# Altium project ESP32_Sound.PrjPcb
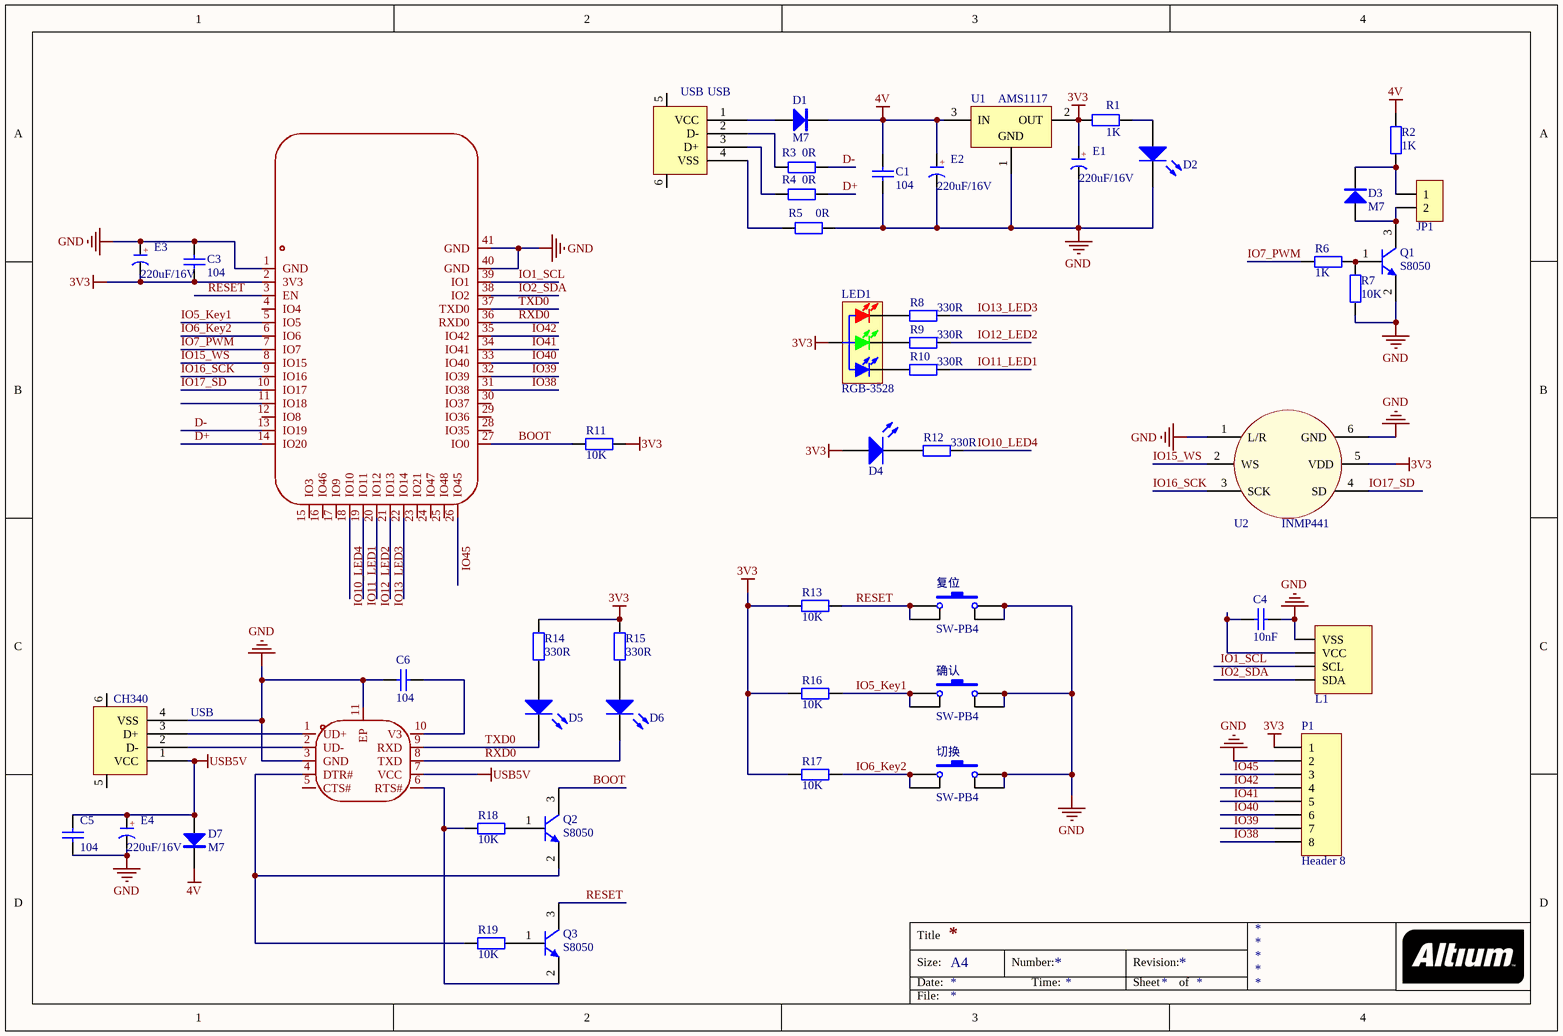
[diagram p0: ESP32_Sound.SchDoc]
1 sheet, 51 parts. Net scope: global (net labels, ports and power ports of the same name join across sheets).
Board file: ESP32_Sound.PcbDoc

## Sheet ESP32_Sound.SchDoc
size A4

### Parts
C1  104  [C 0805]
C3  104  [C 0805]
C4  10nF  [C 0805]
C5  104  [C 0805]
C6  104  [C 0805]
CH340  USB  [H-TypeC]
D1  M7  [DIODE-SMA]
D2  LED  [LED-0805]  (value not drawn)
D3  M7  [DIODE-SMA]
D4  LED  [LED-0805]  (value not drawn)
D5  LED  [LED-0805]  (value not drawn)
D6  LED  [LED-0805]  (value not drawn)
D7  M7  [DIODE-SMA]
E1  220uF/16V  [CAP 2.5*6.3*7]
E2  220uF/16V  [CAP 2.5*6.3*7]
E3  220uF/16V  [CAP 2.5*6.3*7]
E4  220uF/16V  [CAP 2.5*6.3*7]
JP1  HDR-1X2  [SIPA02]  (value not drawn)
L1  LCD12864 IIC  [LCD12864]  (value not drawn)
LED1  RGB-3528  [LED-RGB]
P1  Header 8  [HDR1X8]
Q1  S8050  [SOT89_L]
Q2  S8050  [SOT23-3L]
Q3  S8050  [SOT23-3L]
R1  1K  [R 0805]
R2  1K  [R 0805]
R3  0R  [CR3216-1206]
R4  0R  [CR3216-1206]
R5  0R  [CR3216-1206]
R6  1K  [R 0805]
R7  10K  [R 0805]
R8  330R  [R 0805]
R9  330R  [R 0805]
R10  330R  [R 0805]
R11  10K  [R 0805]
R12  330R  [R 0805]
R13  10K  [R 0805]
R14  330R  [R 0805]
R15  330R  [R 0805]
R16  10K  [R 0805]
R17  10K  [R 0805]
R18  10K  [R 0805]
R19  10K  [R 0805]
U1  AMS1117  [SOT-223]
U2  INMP441  [INMP441]
U3  ESP32-S3-WROOM-1(N16R8)  [WIRELM-SMD_ESP32-S3-WROOM-1]  (value not drawn)
U4  CH340K  [ESOP-10_L4.9-W3.9-P1.00-LS6.2-BL-EP]  (value not drawn)
USB  USB  [H-TypeC]
切换  SW-PB4  [TSW SMD-6*6*5]
复位  SW-PB4  [TSW SMD-6*6*5]
确认  SW-PB4  [TSW SMD-6*6*5]

### Nets
3V3: C3.1 D4.1(A) E1.1(A) E3.2(K) LED1.2(A) P1.1 R1.2 R11.2 R13.1 R14.2 R15.2 R16.1 R17.1 U1.2(OUT) U2.5(VDD) U3.2(3V3)
4V: C1.2 D1.2(K) D7.2(K) E2.1(A) R2.1 U1.3(IN)
GND: C1.1 C3.2 C4.1 C5.1 C6.2 CH340.4(VSS) D2.2(K) E1.2(K) E2.2(K) E3.1(A) E4.2(K) L1.1(VSS) P1.2 Q1.2(E) R5.1 R7.1 U1.1(GND) U2.1(L/R) U2.6(GND) U3.1(GND) U3.40(GND) U3.41(GND) U4.3(GND) U4.11(EP) 切换.2 切换.3 复位.2 复位.3 确认.2 确认.3
USB5V: C5.2 CH340.1(VCC) D7.1(A) E4.1(A) U4.7(VCC)
BOOT: Q2.3(C) R11.1 U3.27(IO0)
D+: R4.1 U3.14(IO20)
D-: R3.1 U3.13(IO19)
IO1_SCL: L1.3(SCL) U3.39(IO1)
IO2_SDA: L1.4(SDA) U3.38(IO2)
IO5_Key1: R16.2 U3.5(IO5) 确认.1 确认.4
IO6_Key2: R17.2 U3.6(IO6) 切换.1 切换.4
IO7_PWM: R6.1 U3.7(IO7)
IO10_LED4: R12.2 U3.18(IO10)
IO11_LED1: R10.2 U3.19(IO11)
IO12_LED2: R9.2 U3.20(IO12)
IO13_LED3: R8.2 U3.21(IO13)
IO15_WS: U2.2(WS) U3.8(IO15)
IO16_SCK: U2.3(SCK) U3.9(IO16)
IO17_SD: U2.4(SD) U3.10(IO17)
IO38: P1.8 U3.31(IO38)
IO39: P1.7 U3.32(IO39)
IO40: P1.6 U3.33(IO40)
IO41: P1.5 U3.34(IO41)
IO42: P1.4 U3.35(IO42)
IO45: P1.3 U3.26(IO45)
RESET: Q3.3(C) R13.2 U3.3(EN) 复位.1 复位.4
RXD0: D6.2(K) U3.36(RXD0) U4.8(TXD)
TXD0: D5.2(K) U3.37(TXD0) U4.9(RXD)
NetC4_2: C4.2 L1.2(VCC)
NetC6_1: C6.1 U4.10(V3)
NetCH340_2: CH340.2(D-) U4.2(UD-)
NetCH340_3: CH340.3(D+) U4.1(UD+)
NetD1_1: D1.1(A) USB.1(VCC)
NetD2_1: D2.1(A) R1.1
NetD3_1: D3.1(A) JP1.2 Q1.3(C)
NetD3_2: D3.2(K) JP1.1 R2.2
NetD4_2: D4.2(K) R12.1
NetD5_1: D5.1(A) R14.1
NetD6_1: D6.1(A) R15.1
NetLED1_1: LED1.1(RED_K) R8.1
NetLED1_3: LED1.3(GREEN_K) R9.1
NetLED1_4: LED1.4(BULE_K) R10.1
NetQ1_1: Q1.1(B) R6.2 R7.2
NetQ2_1: Q2.1(B) R18.2
NetQ2_2: Q2.2(E) R19.1 U4.4(DTR#)
NetQ3_1: Q3.1(B) R19.2
NetQ3_2: Q3.2(E) R18.1 U4.6(RTS#)
NetR3_2: R3.2 USB.2(D-)
NetR4_2: R4.2 USB.3(D+)
NetR5_2: R5.2 USB.4(VSS)

Not connected (* = marked no-connect by the designer): CH340 5 6; U3 4(IO4) 11(IO18) 12(IO8) 15(IO3) 16(IO46) 17(IO9) 22(IO14) 23(IO21) 24(IO47) 25(IO48) 28(IO35) 29(IO36) 30(IO37); U4 5(CTS#); USB 5 6

### Notes on the sheet
- Title
- Size:
- Date:
- A4
- Number:
- Time:
- Revision:
- Sheet
- of
- File:
- (in symbol C-CD) +

### Library data of the parts
C1 = Cap: 无极性电容
C3-C6 = Cap: Capacitor; Value: 1nF; Published: 8-Jun-2000; LatestRevisionDate: 17-Jul-2002; LatestRevisionNote: Re-released for DXP Platform.; PackageReference: RAD-0.3; Publisher: Altium Limited
CH340 USB = USB: USB接口
D1 D3 D7 = SS24: 肖特基二极管; 版权归属: 源创客; 属性: 40V/2A; BOM名称: 肖特基二极管; 学习资源: www.ooocke.com
D2 D4-D6 = LED: 发光二极管; Published: 8-Jun-2000; LatestRevisionDate: 08-Jul-2005; LatestRevisionNote: Mech Layer 1 removed.; PackageReference: LED-0; Publisher: Altium Limited
E1-E4 = C-CD: 贴片钽电容; 版权归属: 源创客; BOM名称: 贴片钽电容; 学习资源: www.ooocke.com
JP1 = Header 2: 2P接插件; 版权归属: 源创客; BOM名称: 2P接插件; 学习资源: www.ooocke.com
L1 = LCD12864 IIC: LCD SSD1306/SSD1315; BOM名称: 4P接插件; 版权归属: 源创客; 学习资源: www.ooocke.com
LED1 = LED-RGB-3528: 三基色LED; 版权归属: 源创客; BOM名称: 三基色LED; 学习资源: www.ooocke.com
P1 = Header 8: Header, 8-Pin; LatestRevisionDate: 17-Jul-2002; LatestRevisionNote: Re-released for DXP Platform.; Publisher: Altium Limited
Q1-Q3 = S8050: NPN三极管
R1 R2 R6 = R-SMT: Resistor; Published: 2026-01-06; Publisher: Altium Limited; Value: 1K
R3-R5 R7-R19 = R-SMT: Resistor; Value: 1K; Published: 2026-01-06; Publisher: Altium Limited
U1 = AMS1117: POSITIVE OUTPUT VOLTAGE
U2 = INMP441: INMP441模块-鹿小班
切换 复位 确认 = SW-PB4: 微动开关; Published: 24-Mar-1999; LatestRevisionDate: 17-Jul-2002; LatestRevisionNote: Re-released for DXP Platform.; PackageReference: SPST-2; Publisher: Altium Limited
U3 = ESP32-S3-WROOM-1(N16R8): Symbol: ESP32-S3-WROOM-1(N16R8)
U4 = CH340K: Symbol: CH340K